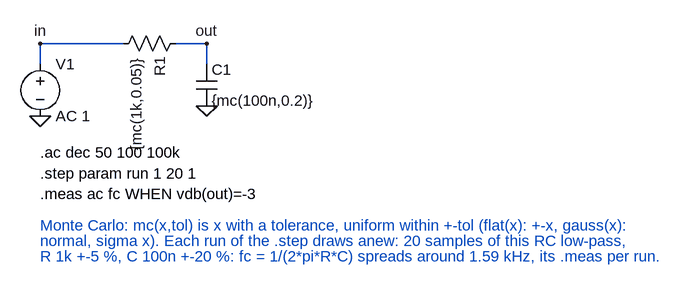
[diagram p0: schematic monte_carlo.asc]
monte_carlo.asc, the LTspice schematic file:
Version 4
SHEET 1 880 680
WIRE -32 64 96 64
WIRE 224 64 176 64
WIRE 224 96 224 64
WIRE -32 96 -32 64
FLAG -32 176 0
FLAG 224 160 0
FLAG 224 64 out
FLAG -32 64 in
SYMBOL voltage -32 80 R0
SYMATTR InstName V1
SYMATTR Value AC 1
SYMBOL res 192 48 R90
SYMATTR InstName R1
SYMATTR Value {mc(1k,0.05)}
SYMBOL cap 208 96 R0
SYMATTR InstName C1
SYMATTR Value {mc(100n,0.2)}
TEXT -32 232 Left 2 !.ac dec 50 100 100k
TEXT -32 264 Left 2 !.step param run 1 20 1
TEXT -32 296 Left 2 !.meas ac fc WHEN vdb(out)=-3
TEXT -32 344 Left 2 ;Monte Carlo: mc(x,tol) is x with a tolerance, uniform within +-tol (flat(x): +-x, gauss(x):
TEXT -32 368 Left 2 ;normal, sigma x). Each run of the .step draws anew: 20 samples of this RC low-pass,
TEXT -32 392 Left 2 ;R 1k +-5 %, C 100n +-20 %: fc = 1/(2*pi*R*C) spreads around 1.59 kHz, its .meas per run.

The netlist it stands for:
* monte_carlo.asc
V1 in 0 AC 1
R1 out in {mc(1k,0.05)}
C1 out 0 {mc(100n,0.2)}
.ac dec 50 100 100k
.step param run 1 20 1
.meas ac fc WHEN vdb(out)=-3
* Monte Carlo: mc(x,tol) is x with a tolerance, uniform within +-tol (flat(x): +-x, gauss(x):
* normal, sigma x). Each run of the .step draws anew: 20 samples of this RC low-pass,
* R 1k +-5 %, C 100n +-20 %: fc = 1/(2*pi*R*C) spreads around 1.59 kHz, its .meas per run.
.backanno
.end